# Altium schematic sheet Match Network.SchDoc
size B; SheetNumber: 12; SheetTotal: 12
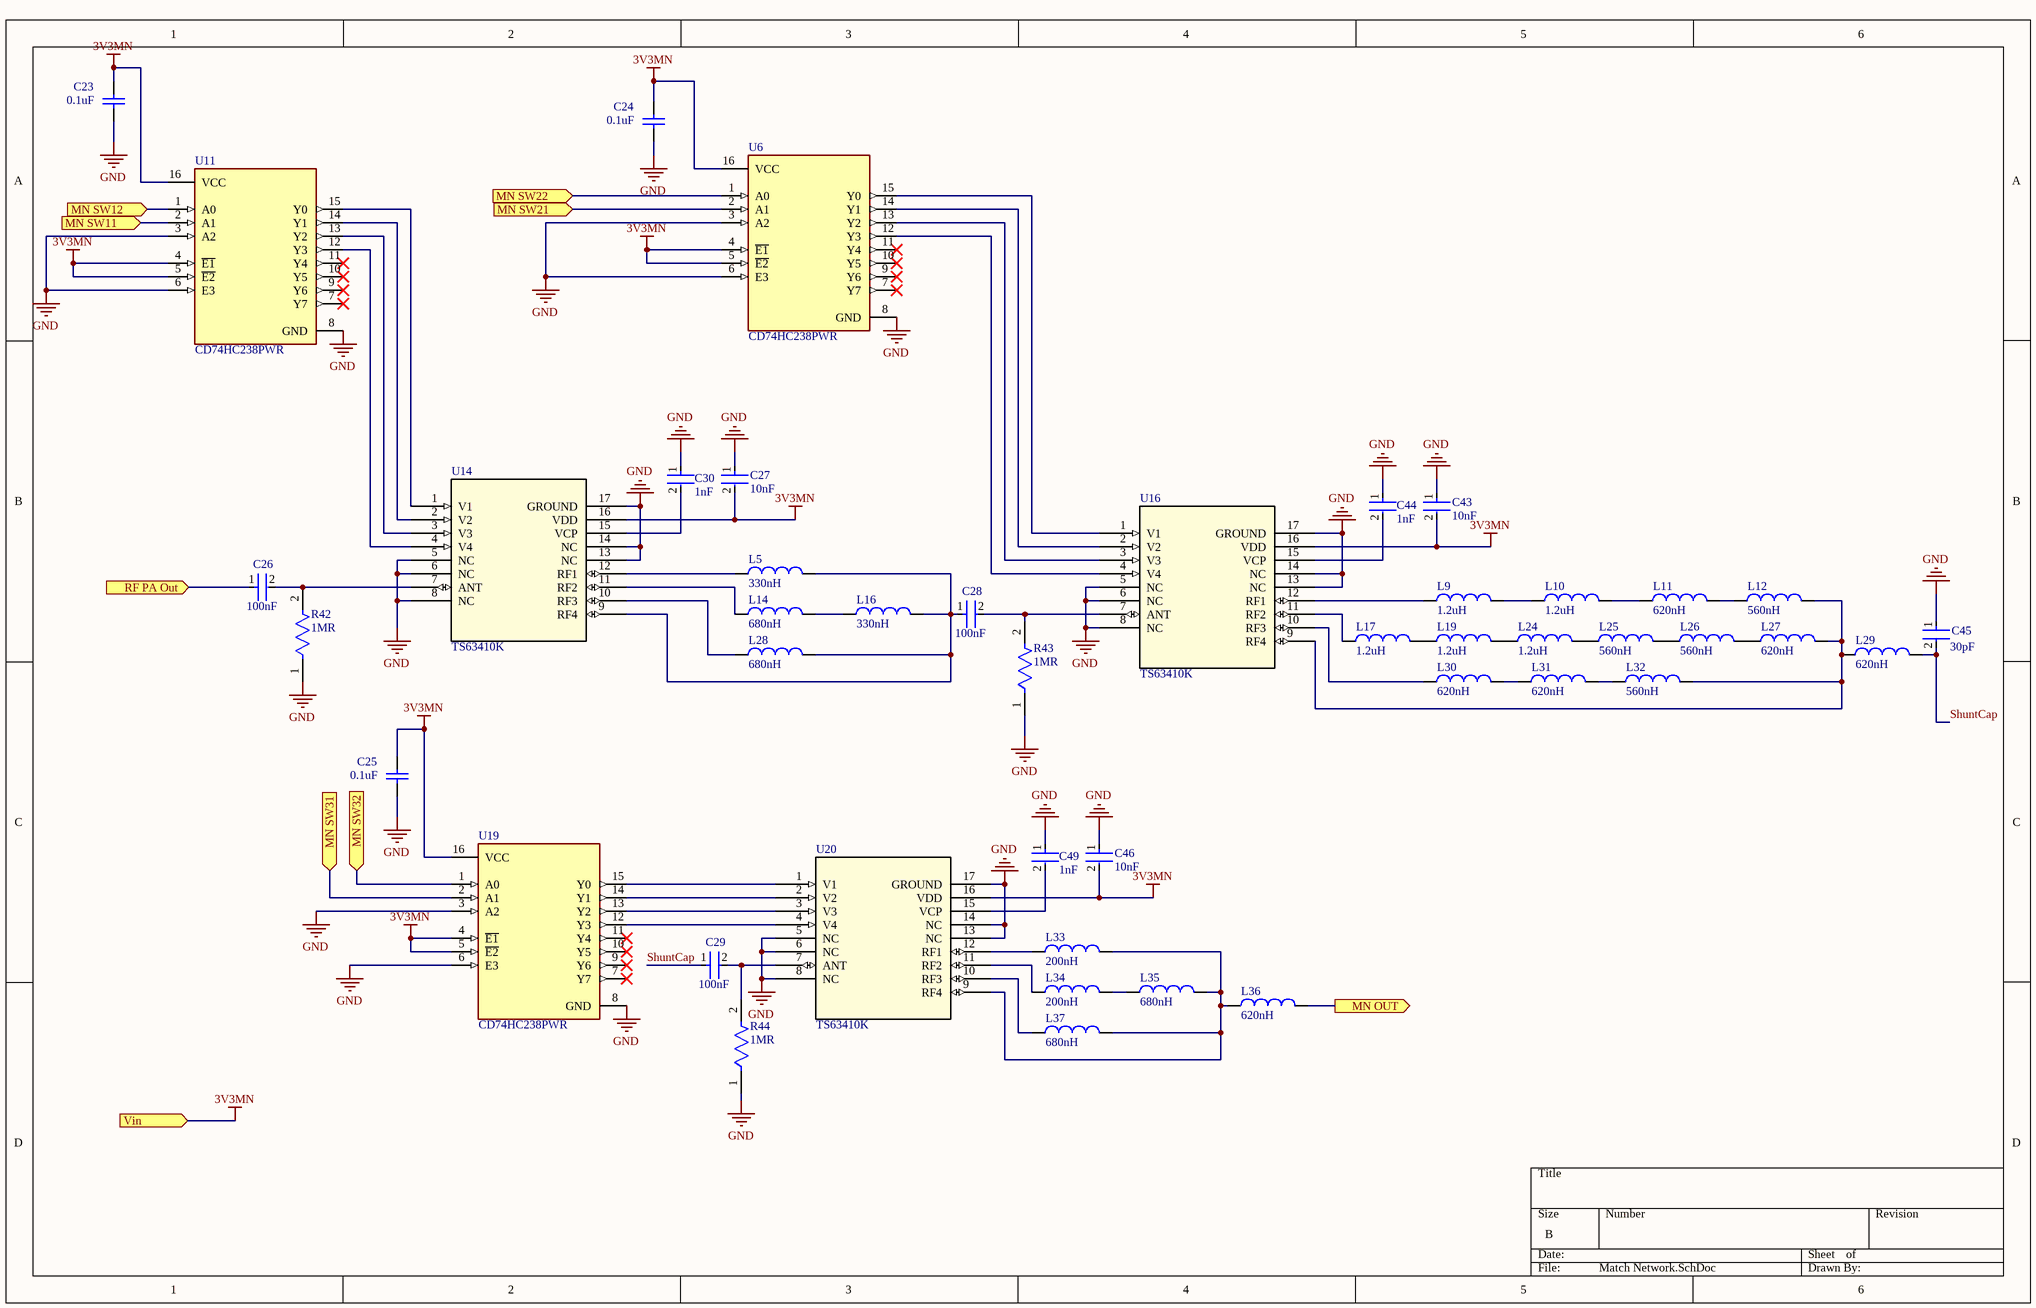
[diagram p0: Match Network.SchDoc]

## Parts
C23  value 0.1uF  [CAPC1608X92X38NL15T08]  (hidden comment: VJ0603Y104KXJAP)
C24  value 0.1uF  [CAPC1608X92X38NL15T08]  (hidden comment: VJ0603Y104KXJAP)
C25  value 0.1uF  [CAPC1608X92X38NL15T08]  (hidden comment: VJ0603Y104KXJAP)
C26  Capacitance: 100nF  [FP-GRM155-0_05-IPC_C]  (hidden comment: GRM155R62A104KE14D)
C27  Capacitance: 10nF  [FP-GCM155-0_05-IPC_C]  (hidden comment: GCM155R71H103KA55D)
C28  Capacitance: 100nF  [FP-GRM155-0_05-IPC_C]  (hidden comment: GRM155R62A104KE14D)
C29  Capacitance: 100nF  [FP-GRM155-0_05-IPC_C]  (hidden comment: GRM155R62A104KE14D)
C30  Capacitance: 1nF  [FP-C0603C-CF-MFG]  (hidden comment: C0603C102K5RACTU)
C43  Capacitance: 10nF  [FP-GCM155-0_05-IPC_C]  (hidden comment: GCM155R71H103KA55D)
C44  Capacitance: 1nF  [FP-C0603C-CF-MFG]  (hidden comment: C0603C102K5RACTU)
C45  Capacitance: 30pF  [FP-GCM188-0_1-IPC_A]  (hidden comment: GCM1885C2A300JA16D)
C46  Capacitance: 10nF  [FP-GCM155-0_05-IPC_C]  (hidden comment: GCM155R71H103KA55D)
C49  Capacitance: 1nF  [FP-C0603C-CF-MFG]  (hidden comment: C0603C102K5RACTU)
L5  value 330nH  [3014]  (hidden comment: XGL3014-331MEC)
L9  value 1.2uH  [3512]  (hidden comment: XGL3512-122MEC)
L10  value 1.2uH  [3512]  (hidden comment: XGL3512-122MEC)
L11  value 620nH  [3512]  (hidden comment: XGL3512-621MEC)
L12  value 560nH  [3020]  (hidden comment: XGL3020-561MEC)
L14  value 680nH  [3020]  (hidden comment: XGL3020-681MEC)
L16  value 330nH  [3014]  (hidden comment: XGL3014-331MEC)
L17  value 1.2uH  [3512]  (hidden comment: XGL3512-122MEC)
L19  value 1.2uH  [3512]  (hidden comment: XGL3512-122MEC)
L24  value 1.2uH  [3512]  (hidden comment: XGL3512-122MEC)
L25  value 560nH  [3020]  (hidden comment: XGL3020-561MEC)
L26  value 560nH  [3020]  (hidden comment: XGL3020-561MEC)
L27  value 620nH  [3512]  (hidden comment: XGL3512-621MEC)
L28  value 680nH  [3020]  (hidden comment: XGL3020-681MEC)
L29  value 620nH  [3512]  (hidden comment: XGL3512-621MEC)
L30  value 620nH  [3512]  (hidden comment: XGL3512-621MEC)
L31  value 620nH  [3512]  (hidden comment: XGL3512-621MEC)
L32  value 560nH  [3020]  (hidden comment: XGL3020-561MEC)
L33  value 200nH  [3014]  (hidden comment: XGL3014-201MEC)
L34  value 200nH  [3014]  (hidden comment: XGL3014-201MEC)
L35  value 680nH  [3020]  (hidden comment: XGL3020-681MEC)
L36  value 620nH  [3512]  (hidden comment: XGL3512-621MEC)
L37  value 680nH  [3020]  (hidden comment: XGL3020-681MEC)
R42  Resistance: 1MR  [FP-ERJ3EK-IPC_C]  (hidden comment: ERJ-3EKF1004V)
R43  Resistance: 1MR  [FP-ERJ3EK-IPC_C]  (hidden comment: ERJ-3EKF1004V)
R44  Resistance: 1MR  [FP-ERJ3EK-IPC_C]  (hidden comment: ERJ-3EKF1004V)
U6  CD74HC238PWR  [FP-PW0016A-IPC_B]
U11  CD74HC238PWR  [FP-PW0016A-IPC_B]
U14  TS63410K  [QFN16_3x3x0p8_TGT]
U16  TS63410K  [QFN16_3x3x0p8_TGT]
U19  CD74HC238PWR  [FP-PW0016A-IPC_B]
U20  TS63410K  [QFN16_3x3x0p8_TGT]

## Ports
MN OUT (out), MN SW11 (in), MN SW12 (in), MN SW21 (in), MN SW22 (in), MN SW31 (in), MN SW32 (in), RF PA Out (in), Vin (in)

## Nets
3V3MN: C23.2 C24.2 C25.2 C27.2 C43.2 C46.2 U6.4(~{E1}) U6.5(~{E2}) U6.16(VCC) U11.4(~{E1}) U11.5(~{E2}) U11.16(VCC) U14.16(VDD) U16.16(VDD) U19.4(~{E1}) U19.5(~{E2}) U19.16(VCC) U20.16(VDD) ; port Vin
GND: C23.1 C24.1 C25.1 C27.1 C30.1 C43.1 C44.1 C45.1 C46.1 C49.1 R42.1 R43.1 R44.1 U6.3(A2) U6.6(E3) U6.8(GND) U11.3(A2) U11.6(E3) U11.8(GND) U14.5(NC) U14.6(NC) U14.8(NC) U14.13(NC) U14.14(NC) U14.17(GROUND) U16.5(NC) U16.6(NC) U16.8(NC) U16.13(NC) U16.14(NC) U16.17(GROUND) U19.3(A2) U19.6(E3) U19.8(GND) U20.5(NC) U20.6(NC) U20.8(NC) U20.13(NC) U20.14(NC) U20.17(GROUND)
MN OUT: L36.2 ; port MN OUT
MN SW11: U11.2(A1) ; port MN SW11
MN SW12: U11.1(A0) ; port MN SW12
MN SW21: U6.2(A1) ; port MN SW21
MN SW22: U6.1(A0) ; port MN SW22
MN SW31: U19.2(A1) ; port MN SW31
MN SW32: U19.1(A0) ; port MN SW32
RF PA Out: C26.1 ; port RF PA Out
ShuntCap: C29.1 C45.2 L29.2
NetC26_2: C26.2 R42.2 U14.7(ANT)
NetC28_1: C28.1 L5.2 L16.2 L28.2 U14.9(RF4)
NetC28_2: C28.2 R43.2 U16.7(ANT)
NetC29_2: C29.2 R44.2 U20.7(ANT)
NetC30_2: C30.2 U14.15(VCP)
NetC44_2: C44.2 U16.15(VCP)
NetC49_2: C49.2 U20.15(VCP)
NetL5_1: L5.1 U14.12(RF1)
NetL9_1: L9.1 U16.12(RF1)
NetL9_2: L9.2 L10.1
NetL10_2: L10.2 L11.1
NetL11_2: L11.2 L12.1
NetL12_2: L12.2 L27.2 L29.1 L32.2 U16.9(RF4)
NetL14_1: L14.1 U14.11(RF2)
NetL14_2: L14.2 L16.1
NetL17_1: L17.1 U16.11(RF2)
NetL17_2: L17.2 L19.1
NetL19_2: L19.2 L24.1
NetL24_2: L24.2 L25.1
NetL25_2: L25.2 L26.1
NetL26_2: L26.2 L27.1
NetL28_1: L28.1 U14.10(RF3)
NetL30_1: L30.1 U16.10(RF3)
NetL30_2: L30.2 L31.1
NetL31_2: L31.2 L32.1
NetL33_1: L33.1 U20.12(RF1)
NetL33_2: L33.2 L35.2 L36.1 L37.2 U20.9(RF4)
NetL34_1: L34.1 U20.11(RF2)
NetL34_2: L34.2 L35.1
NetL37_1: L37.1 U20.10(RF3)
NetU6_12: U6.12(Y3) U16.4(V4)
NetU6_13: U6.13(Y2) U16.3(V3)
NetU6_14: U6.14(Y1) U16.2(V2)
NetU6_15: U6.15(Y0) U16.1(V1)
NetU11_12: U11.12(Y3) U14.4(V4)
NetU11_13: U11.13(Y2) U14.3(V3)
NetU11_14: U11.14(Y1) U14.2(V2)
NetU11_15: U11.15(Y0) U14.1(V1)
NetU19_12: U19.12(Y3) U20.4(V4)
NetU19_13: U19.13(Y2) U20.3(V3)
NetU19_14: U19.14(Y1) U20.2(V2)
NetU19_15: U19.15(Y0) U20.1(V1)

Not connected (* = marked no-connect by the designer): U6 7(Y7)* 9(Y6)* 10(Y5)* 11(Y4)*; U11 7(Y7)* 9(Y6)* 10(Y5)* 11(Y4)*; U19 7(Y7)* 9(Y6)* 10(Y5)* 11(Y4)*

## Library data of the parts
C23-C25 = CMP-2006-01211-1: Manufacturer: Vitramon; Part Number: VJ0603Y104KXJAP
C26 C28 C29 = CMP-06035-008289-1: Chip Multilayer Ceramic Capacitors for General Purpose, 0402, 0.10uF, X5R, 15%, 10%, 100V; Case Code (Metric): 1005; Width: 0.5mm; Case/Package: 0402; Case Code (Imperial): 0402; Voltage Rating (DC): 100V; Package Quantity: 10000; Length: 0.039inch; Height: 0.5mm; Max Operating Temperature: 85°C; Lead Free: Lead Free; Termination: SMD/SMT; Mount: Surface Mount; Tolerance: 10%; Packaging: Tape and Reel; Voltage Rating: 100V; Thickness: 0.022inch; Dielectric: X5R; REACH SVHC: No SVHC; Min Operating Temperature: -55°C; Weight: 0.000212oz
C27 C43 C46 = CMP-2008-03723-3: Ceramic Capacitor for Automotive 10nF ±10% 50VDC X7R 0402 Paper T/R; Voltage Rating (DC): 50V; Min Operating Temperature: -55°C; Radiation Hardening: No; Mount: Surface Mount; Thickness: 0.022inch; Package Quantity: 1; Case Code (Imperial): 0402; Lead Free: Lead Free; Case/Package: 0402; Depth: 0.5mm; Termination: SMD/SMT; Tolerance: 10%; Voltage: 50V; Packaging: Tape and Reel; Width: 0.02inch; REACH SVHC: No SVHC; Height: 0.5mm; Max Operating Temperature: 125°C; Case Code (Metric): 1005; Voltage Rating: 50V; Ratings: AEC-Q200; Length: 1mm; Dielectric: X7R
C30 C44 C49 = CMP-2006-03022-3: CAP CER 1000PF 50V X7R 0603; Manufacturer: KEMET; Automotive Grade: Grade 1; Tolerance: 0.1; Value: 1,000 pF; Temperature Coefficient: 30ppm/°C; Material: Ceramic; Temperature Characteristic: X7R; ComponentLink2URL: https://api.kemet.com/component-edge/download/datasheet/C0603C100J5GACAUTO.pdf; Temperature Range Low: -55°C; Device Class L2: Capacitors; Device Class L3: Ceramic Capacitors; Device Class L1: Passive Components; Temperature Range High: +125°C; Manufacturer Part Number: C0603C102K5RACTU; Digikey Description: CAP CER 1000PF 50V X7R 0603; Temperature: -55°C to +125°C; Voltage Rating: 50 V; Mouser Description: Capacitor; Ceramic; Cap; 1000pF; Tol 10%; SMT; Vol-Rtg 50V; X7R; Tape and Reel; Automotive: Yes; RoHS: TRUE; Octopart: https://octopart.com/c0603c102k5ractu-kemet-144878; Height: 0.87mm; Package: C0603C-CF; Lead Free: Yes; Category: Cap; ComponentLink2Description: Datasheet
C45 = CMP-06035-034328-1: Ceramic Capacitor for Automotive 30pF  ±5% 100VDC C0G 0603 Paper T/R; Voltage Rating: 100V; Radiation Hardening: No; Case Code (Metric): 1608; Height: 0.8mm; Length: 1.6mm; Thickness: 0.035inch; Width: 0.8mm; Package Quantity: 4000; Max Operating Temperature: 125°C; Case Code (Imperial): 0603; Dielectric: C0G; Voltage Rating (DC): 100V; Case/Package: 0603; Min Operating Temperature: -25°C; Packaging: Tape and Reel; Depth: 0.8mm; Tolerance: 5%; Mount: Surface Mount; Termination: SMD/SMT; Ratings: AEC-Q200
L5 L16 = Inductor: XGL3014-331MEC General Purpose Inductor, 0.33uH, 20%, 1 Element, Composite-Core, SMD, 1212 Fixed Inductors     1212  20% 1.4mm; SimulationGenericComponent: True
L9 L10 L17 L19 L24 = Inductor: General Purpose Inductor, XGL3512-122MEC 1.2uH, 20%, 1 Element, Composite-Core, SMD, 1413 Fixed Inductors       20% 1.2mm; SimulationGenericComponent: True
L11 L27 L29-L31 L36 = Inductor: XGL3512-621MEC General Purpose Inductor, 0.62uH, 20%, 1 Element, Composite-Core, SMD, 1413 Fixed Inductors       20% 1.2mm; SimulationGenericComponent: True
L12 L14 L25 L26 L28 L32 L35 L37 = Inductor: SimulationGenericComponent: True
L33 L34 = Inductor: General Purpose Inductor, 0.2uH, 20%, 1 Element, Composite-Core, SMD, 1212 Fixed Inductors     1212  20% 1.4mm; SimulationGenericComponent: True
R42-R44 = CMP-1012-00849-3: RES SMD 1M OHM 1% 1/10W 0603; Voltage Rating: 75V; Temperature Coefficient: 100ppm/°C; Power Rating: 100mW; REACH SVHC: No SVHC; Radiation Hardening: No; Features: Automotive AEC-Q200; Case Code (Metric): 1608; Resistance Tolerance: 1%; Case/Package: 0603; Termination: SMD/SMT; Max Operating Temperature: 155°C; Tolerance: 1%; Size Code: 0603; Case Code (Imperial): 0603; Min Operating Temperature: -55°C; Number of Pins: 2; Mount: Surface Mount; Package Quantity: 1; Military Standard: Not; Voltage Rating (DC): 75V; Depth: 0.8mm; Packaging: Tape and Reel; Width: 0.8mm; Number of Terminations: 2; Length: 1.6mm; Height: 0.022inch; RoHS Compliant: Yes; Resistor Type: Thick Film; Contact Plating: Tin; Lead Free: Lead Free; Series: ERJ; Construction: Rectangular; Max Power Dissipation: 100mW
U6 U11 U19 = CMP-1633-00899-3: IC DECODER/DEMUX 1X3:8 16TSSOP; Max Supply Voltage: 6V; Low Level Output Current: 5.2mA; Number of Channels: 1; Quiescent Current: 8uA; Min Supply Voltage: 2V; Supply Type: Single; Polarity: Non-Inverting; Number of Input Lines: 3; Output Current: 25mA; Turn-On Delay Time: 265ns; Number of Output Lines: 8; Logic Function: Demultiplexer; High Level Output Current: -5.2mA; Rise Time: 400ns; Bandwidth: 28MHz; Max Operating Temperature: 125°C; Independent Circuits: 1; Weight: 0.002183oz; Radiation Hardening: No; Output Voltage: 6V; Min Operating Temperature: -55°C; Package Quantity: 2000; REACH SVHC: No SVHC; Packaging: Tape and Reel; Lead Free: Lead Free; Contact Plating: Gold; Mount: Surface Mount; Height: 1.15mm; Case/Package: TSSOP; Number of Bits: 8; Number of Inputs: 3; Termination: SMD/SMT; Number of Outputs: 8; Number of Pins: 16; Number of Circuits: 1; Max Supply Current: 8uA; Series: 74HC; Number of Elements: 1; RoHS Compliant: Yes; Length: 5mm; Propagation Delay: 265ns; Width: 4.4mm; Technology: CMOS; Max Frequency: 28MHz
U14 U16 U20 = TS63410K: Description; Manufacturer_Name: TagoreTech; Copyright: Copyright (C) 2026 Ultra Librarian. All rights reserved.; Manufacturer_Part_Number: TS63410K; RefDes: RefDes; Type: Type